# Altium schematic sheet signal-light-16.SchDoc
size A4; SheetNumber: 19; SheetTotal: 21
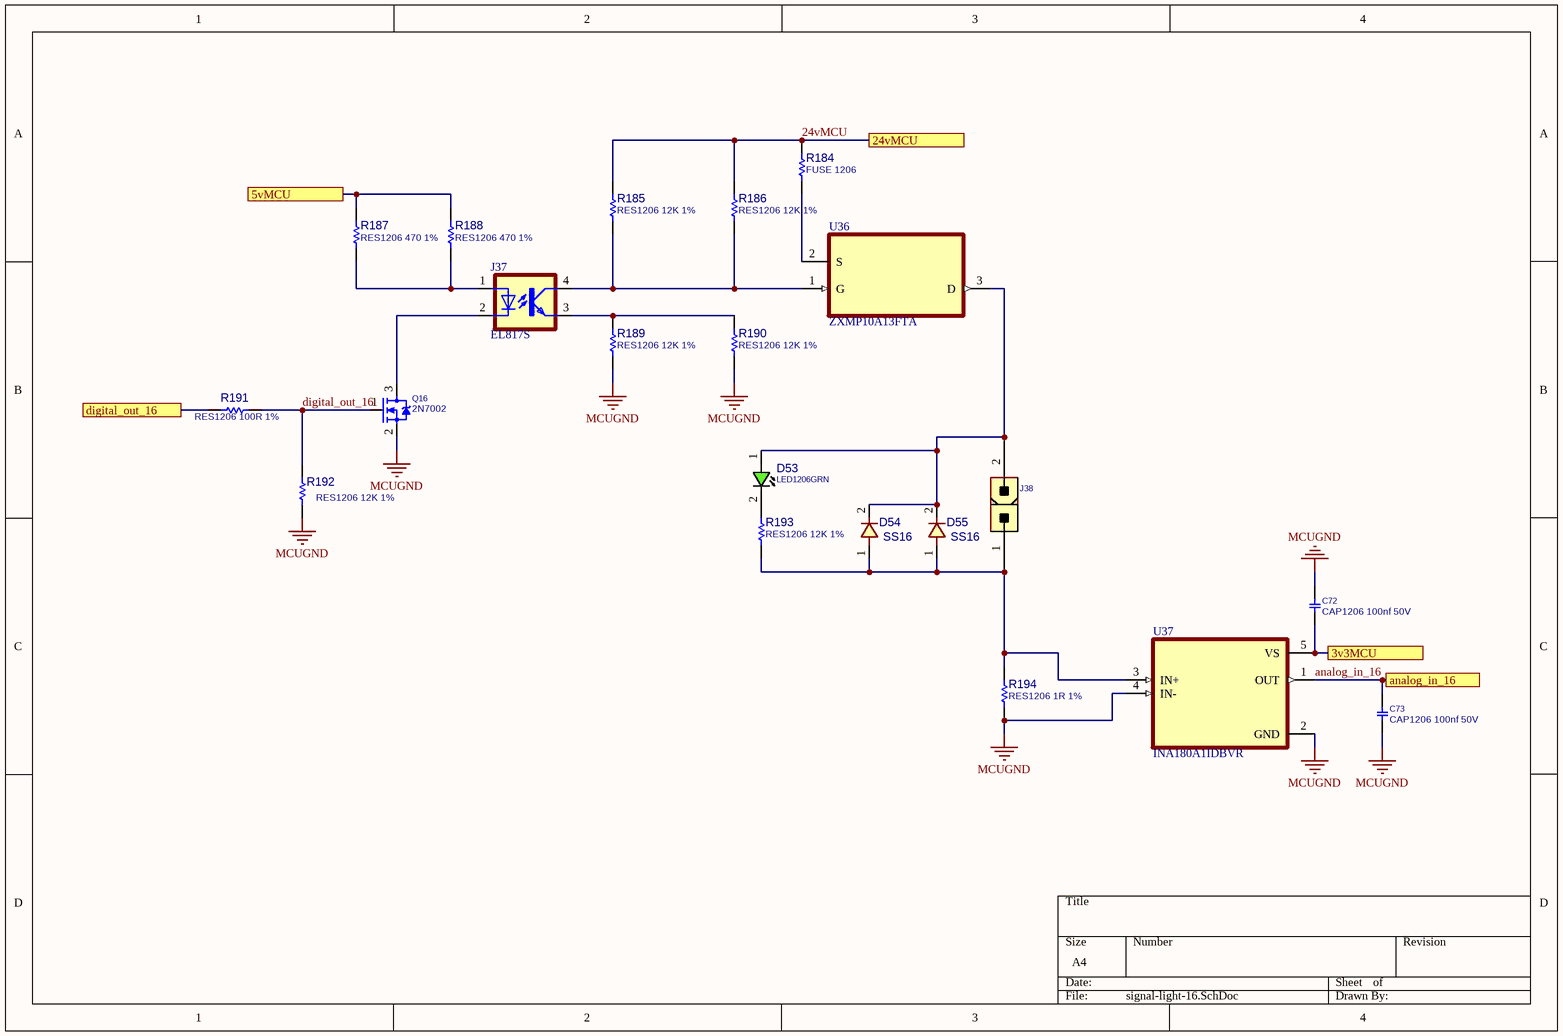
[diagram p0: signal-light-16.SchDoc]

## Parts
C72  CAP1206 100nf 50V  [C1206]
C73  CAP1206 100nf 50V  [C1206]
D53  LED1206GRN  [LED1206GRN]
D54  SS16  [D_SMA]
D55  SS16  [D_SMA]
J37  EL817S  [SOIC254P1030X460-4N]
J38  CONN_ATXPWR_2  [ATXPWR_2]  (value not drawn)
Q16  2N7002  [SOT23_3]
R184  FUSE 1206  [R1206]
R185  RES1206 12K 1%  [R1206]
R186  RES1206 12K 1%  [R1206]
R187  RES1206 470 1%  [R1206]
R188  RES1206 470 1%  [R1206]
R189  RES1206 12K 1%  [R1206]
R190  RES1206 12K 1%  [R1206]
R191  RES1206 100R 1%  [R1206]
R192  RES1206 12K 1%  [R1206]
R193  RES1206 12K 1%  [R1206]
R194  RES1206 1R 1%  [R1206]
U36  ZXMP10A13FTA  [SOT95P230X110-3N]
U37  INA180A1IDBVR  [SOT95P280X145-5N]

## Ports
3v3MCU, 5vMCU, 24vMCU, analog_in_16, digital_out_16

## Nets
MCUGND: C72.1 C73.2 Q16.2(SOURCE) R189.2 R190.2 R192.2 R194.2 U37.2(GND) U37.4(IN-)
3v3MCU: C72.2 U37.5(VS) ; port 3v3MCU
5vMCU: R187.2 R188.2 ; port 5vMCU
24vMCU: R184.1 R185.1 R186.1 ; port 24vMCU
analog_in_16: C73.1 U37.1(OUT) ; port analog_in_16
digital_out_16: Q16.1(GATE) R191.2 R192.1
digital_out_16: R191.1 ; port digital_out_16  [a separate net that carries the same name]
NetD53_1: D53.1(ANODE) D54.2 D55.2 J38.2 U36.3(D)
NetD53_2: D53.2(CATHODE) R193.1
NetD54_1: D54.1 D55.1 J38.1 R193.2 R194.1 U37.3(IN+)
NetJ37_1: J37.1(A) R187.1 R188.1
NetJ37_2: J37.2(C) Q16.3(DRAIN)
NetJ37_3: J37.3(EMIT) R189.1 R190.1
NetJ37_4: J37.4(COL) R185.2 R186.2 U36.1(G)
NetR184_2: R184.2 U36.2(S)

## Library data of the parts
C72 C73 = CAP_SMD_MLCC_1206: CAP, MLCC; PARAM: -, -%; MANF_P#: MANF_PART#; PARAM2: -V; PRICE: 100= 1$; MANF: -; ASSEMBLY: ASSEMBLY
D53 = LED_SMD_1206_GRN: LED, SMD, 1206, GREEN; PARAM: 20mA; DESC: DESCRIPTION; PARAM2: 2.2V; MANF: -; ASSEMBLY: ASSEMBLY; PRICE: 36t@Javan; MANF_P#: -; VALUE: LED1206GRN; MountType: SMT; PartType: LED
D54 D55 = DIODE_SMD_1N4001: DIODE, GENERAL PURPOSE, 50V/1A; DESC: DESCRIPTION; PARAM: 50V VRRM; PARAM2: 1A; MANF_P#: 1N4001; MANF: MANF; ASSEMBLY: ASSEMBLY; PRICE: PRICE; VALUE: SS16
J37 = EL817S: Optoisolator Transistor Output 5000Vrms 1 Channel 4-SMD; MF: Everlight Electronics; SnapEDA_Link: https://www.snapeda.com/parts/EL817S/Everlight+Electronics+Co+Ltd/view-part/?ref=snap; Package: SMD-4 Everlight Electronics Co Ltd; Value: *; MP: EL817S; Check_prices: https://www.snapeda.com/parts/EL817S/Everlight+Electronics+Co+Ltd/view-part/?ref=eda
J38 = CONN_ATXPWR_2: CONN, ATX POWER, 2 P; MANF: Molex; MANF_P#: 39281023; VALUE: CONN_ATXPWR_2; MountType: THD; PACKAGE: ATXPWR-2pin; Part Type: Conn.
Q16 = MOSN_2N7002_SOT23: MOSFET, N-CH, 60V, 0.3A; MANF: NXP; ASSEMBLY: ASSEMBLY; MANF_P#: 2N7002; PARAM2: 60v; PARAM: 0.3A; PRICE: 0.3t@Javan; VALUE: 2N7002
R184-R194 = RES_SMD_1206: RESISTOR, SMD; PARAM: 1%, 0.25W; DESC: DESCRIPTION; DIST#: MOUSER; MANF_P#: -; MANF: -; ASSEMBLY: ASSEMBLY; PRICE: -; PARAM2: -
U36 = ZXMP10A13FTA: P-Channel 100 V 600mA (Ta) 625mW (Ta) Surface Mount SOT-23-3; MF: Diodes Inc.; Purchase-URL: https://pricing.snapeda.com/search/part/ZXMP10A13FTA/?ref=eda; Package: SOT-23-3 Diodes Inc.; SnapEDA_Link: https://www.snapeda.com/parts/ZXMP10A13FTA/Diodes+Inc./view-part/?ref=snap; Availability: In Stock; Value: *; MP: ZXMP10A13FTA; Check_prices: https://www.snapeda.com/parts/ZXMP10A13FTA/Diodes+Inc./view-part/?ref=eda; Price: None
U37 = INA180A1IDBVR: 26V, 350kHz current sense amplifier; MF: Texas Instruments; SnapEDA_Link: https://www.snapeda.com/parts/INA180A1IDBVR/Texas+Instruments/view-part/?ref=snap; Package: SOT-23-5 Texas Instruments; Value: *; MP: INA180A1IDBVR; Check_prices: https://www.snapeda.com/parts/INA180A1IDBVR/Texas+Instruments/view-part/?ref=eda